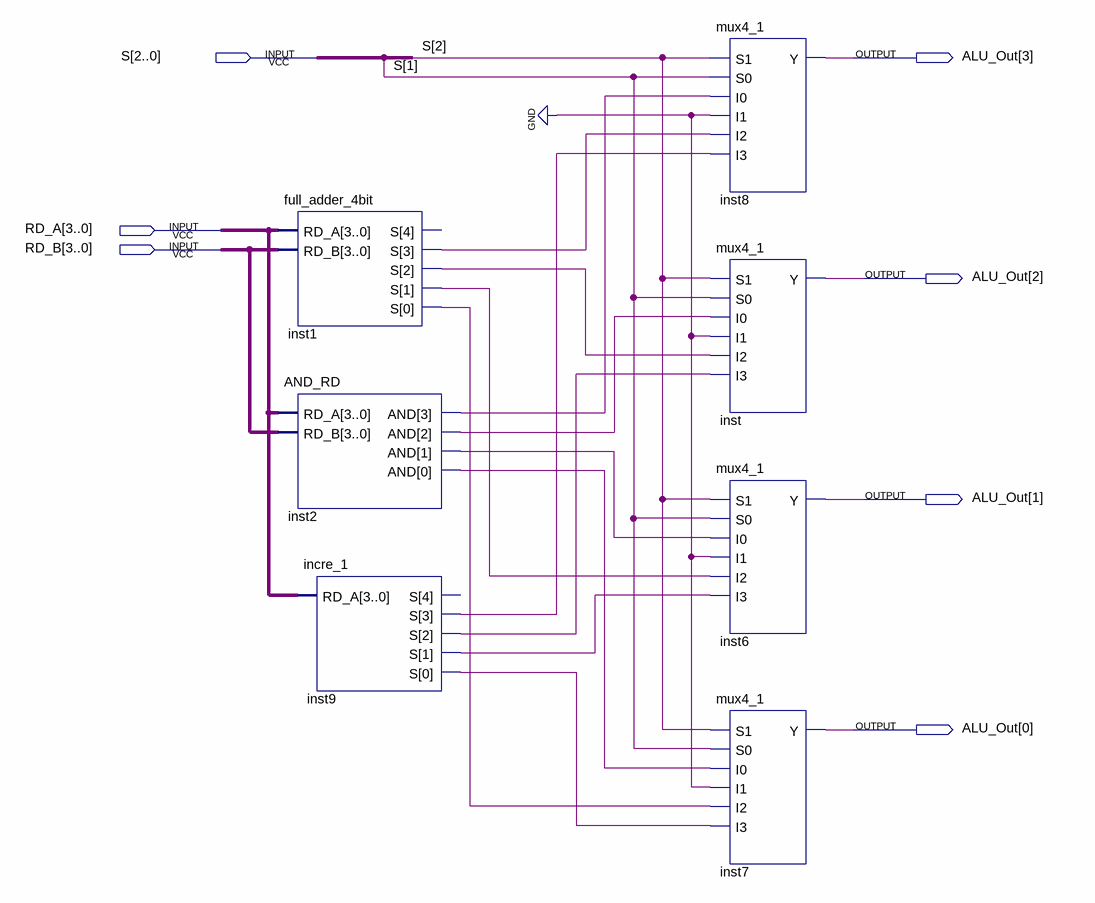
[diagram p0: schematic sheet]
// Quartus schematic ALU.bdf as structural Verilog: 7 symbols, 7 pins
module ALU (
  input  [2:0] S,
  input  [3:0] RD_A,
  input  [3:0] RD_B,
  output [3:0] ALU_Out
);

  wire inst1_s, inst1_s_2, inst1_s_3, inst1_s_4, inst2_and, inst2_and_2, inst2_and_3, inst2_and_4, inst9_s,
       inst9_s_2, inst9_s_3, inst9_s_4;
  wire [4:0] inst9_s_open;  // unused outputs
  wire [4:0] inst1_s_open;  // unused outputs

  full_adder_4bit inst1 (.RD_A(RD_A), .RD_B(RD_B), .S({inst1_s_open[4], inst1_s, inst1_s_2, inst1_s_3, inst1_s_4}));
  AND_RD inst2 (.RD_A(RD_A), .RD_B(RD_B), .AND({inst2_and, inst2_and_2, inst2_and_3, inst2_and_4}));
  incre_1 inst9 (.RD_A(RD_A), .S({inst9_s_open[4], inst9_s, inst9_s_2, inst9_s_3, inst9_s_4}));
  mux4_1 inst8 (.S1(S[2]), .S0(S[1]), .I0(inst2_and), .I1(1'b0), .I2(inst1_s), .I3(inst9_s), .Y(ALU_Out[3]));
  mux4_1 inst (.S1(S[2]), .S0(S[1]), .I0(inst2_and_2), .I1(1'b0), .I2(inst1_s_2), .I3(inst9_s_2), .Y(ALU_Out[2]));
  mux4_1 inst6 (.S1(S[2]), .S0(S[1]), .I0(inst2_and_3), .I1(1'b0), .I2(inst1_s_3), .I3(inst9_s_3), .Y(ALU_Out[1]));
  mux4_1 inst7 (.S1(S[2]), .S0(S[1]), .I0(inst2_and_4), .I1(1'b0), .I2(inst1_s_4), .I3(inst9_s_4), .Y(ALU_Out[0]));
endmodule
